# Altium schematic sheet 1_P1.schdoc
size 601 x 429 mm; Symbol: Sheet-Symbol_A3; Device: Sheet-Symbol_A3; Company: 嘉立创EDA; Version: V1.0; Page Size: A3; @Project Name: ESP-SparkBot; @Page Count: 1; @Update Date: 2024-12-25; @Create Date: 2024-10-15; @Schematic Name: SCH_ESP_SparkBot; @Page No: 1; @Page Name: P1; @Board Name: ESP_SparkBot_MainBoard; @Create Time: 11:45:12; @Update Time: 18:40:32; Width: 2338; Height: 1652; Region Start: 1; X Region Count: 6; Y Region Count: 4; Blade Width: 10; Title Block Position: 3
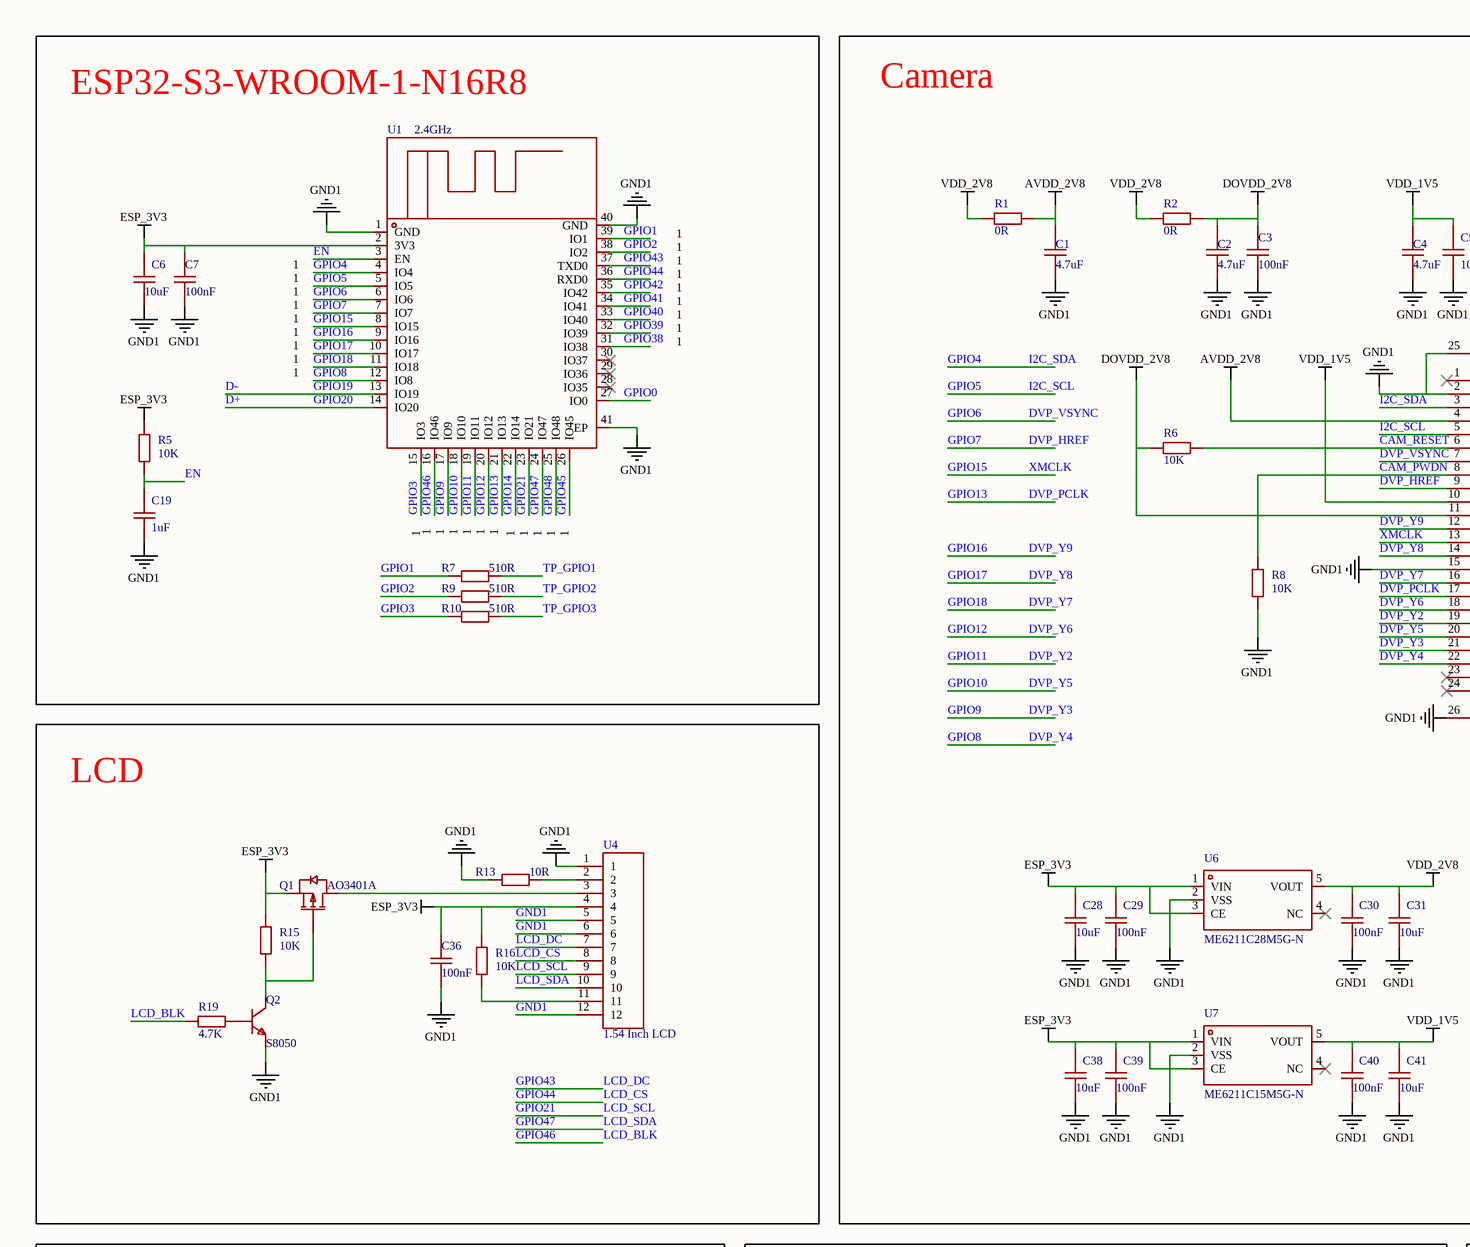
[diagram p0: 1_P1.schdoc, top left]
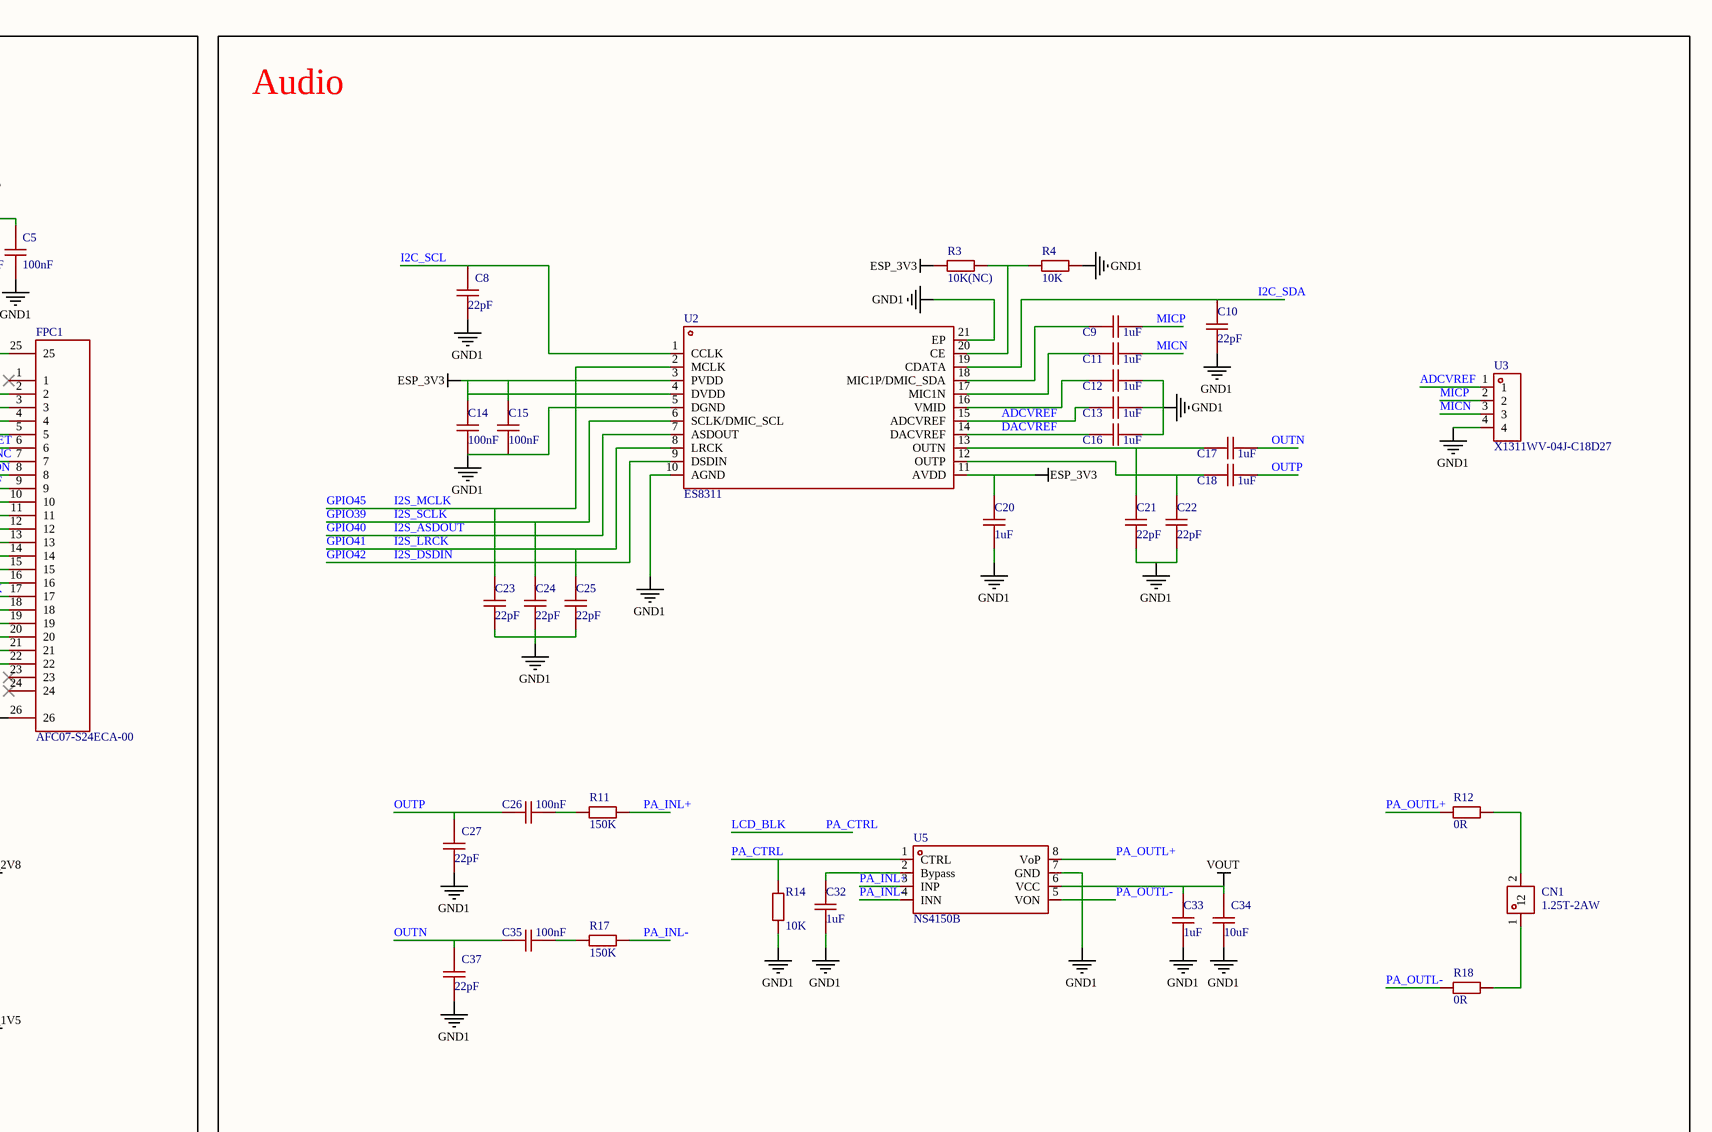
[diagram p1: 1_P1.schdoc, top right]
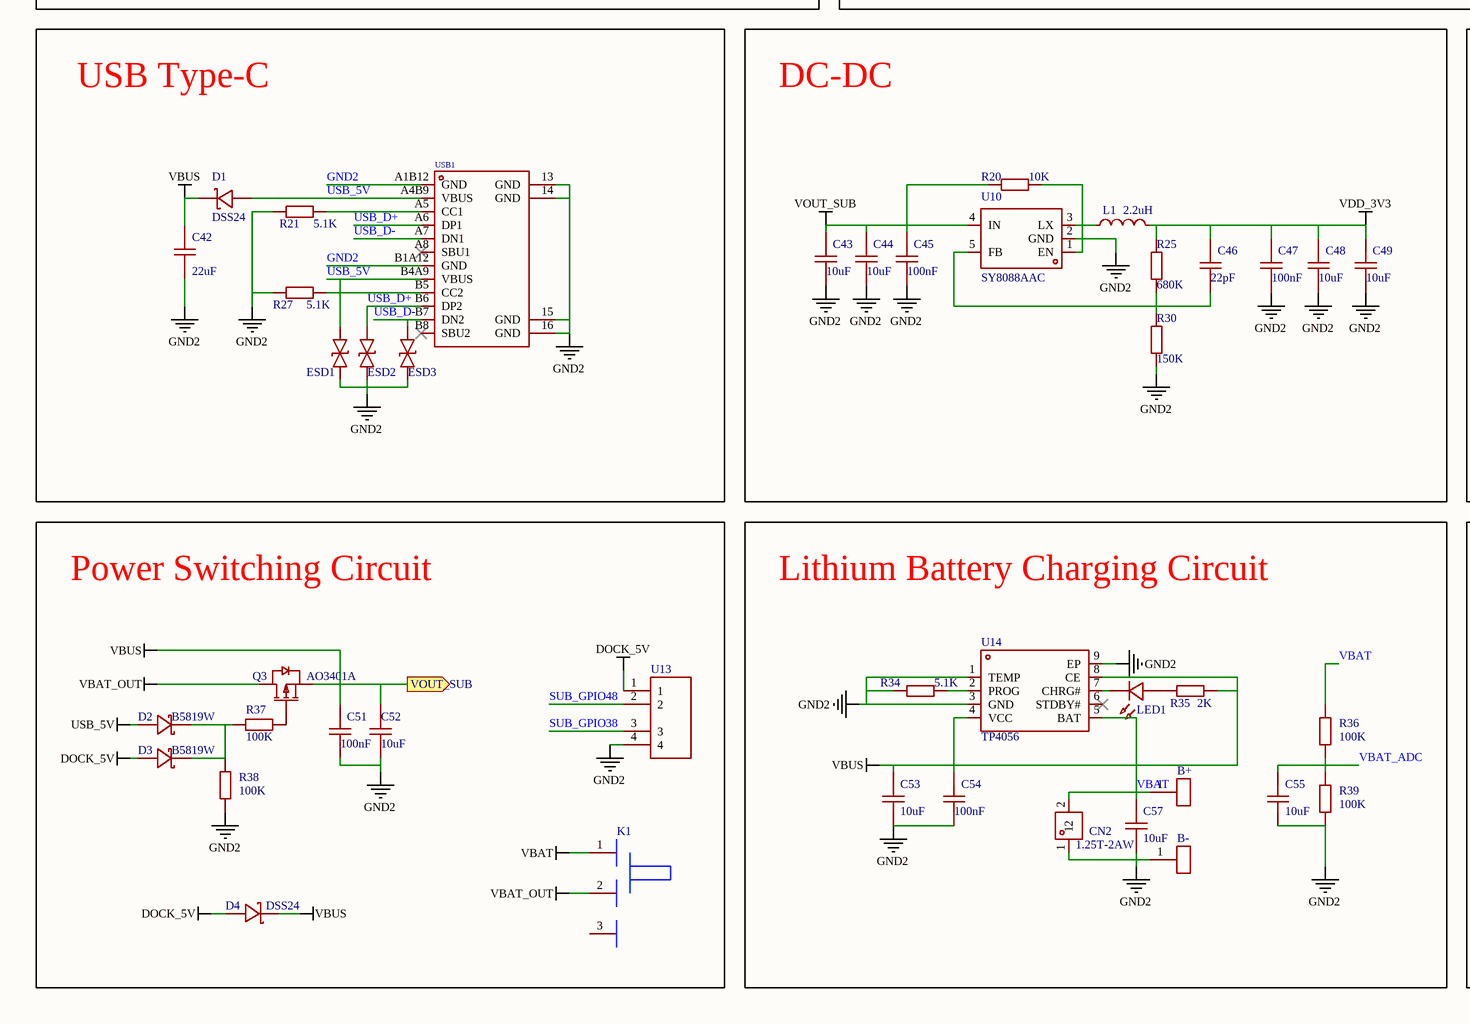
[diagram p2: 1_P1.schdoc, bottom left]
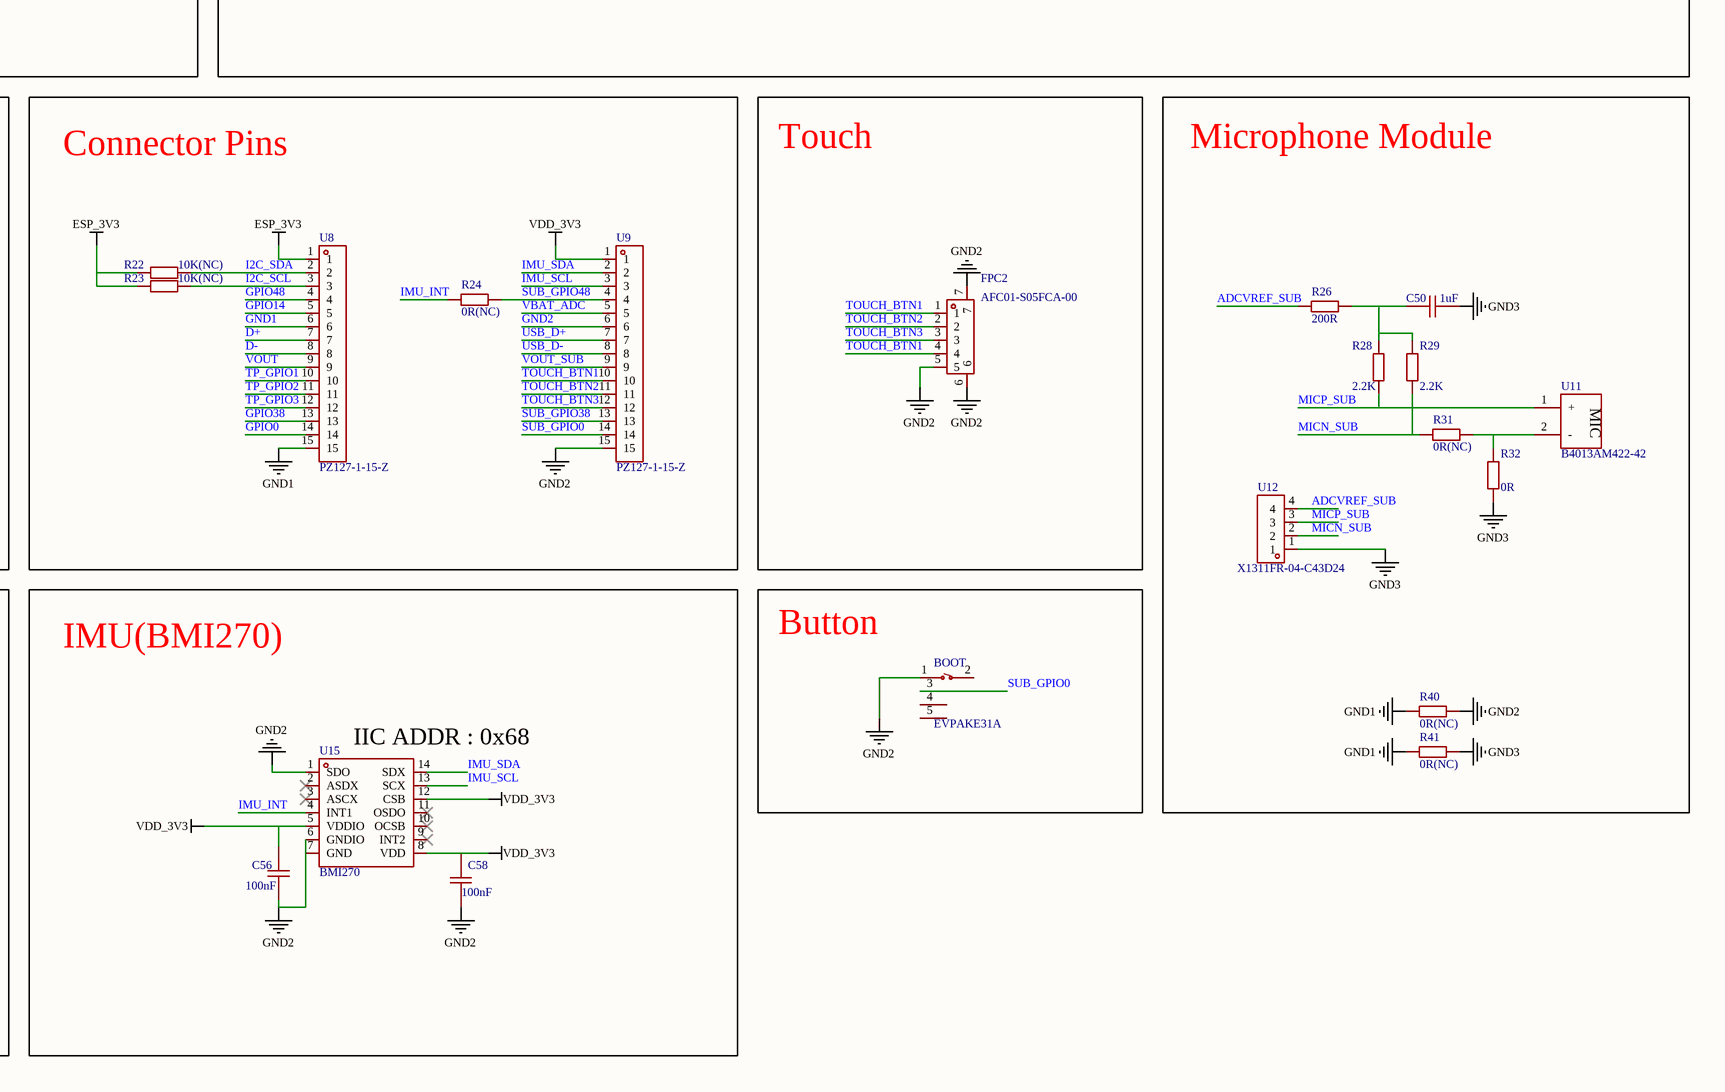
[diagram p3: 1_P1.schdoc, bottom right]

## Parts
B+  (no value)  [test_point]
B-  (no value)  [test_point]
BOOT  EVPAKE31A  [SW-TH_PANASONIC_EVPAKE31A]
C1  4.7uF  [C0402]
C2  4.7uF  [C0402]
C3  100nF  [C0402]
C4  4.7uF  [C0402]
C5  100nF  [C0402]
C6  10uF  [C0603]
C7  100nF  [C0402]
C8  22pF  [C0402]
C9  1uF  [C0402]
C10  22pF  [C0402]
C11  1uF  [C0402]
C12  1uF  [C0402]
C13  1uF  [C0402]
C14  100nF  [C0402]
C15  100nF  [C0402]
C16  1uF  [C0402]
C17  1uF  [C0402]
C18  1uF  [C0402]
C19  1uF  [C0402]
C20  1uF  [C0402]
C21  22pF  [C0402]
C22  22pF  [C0402]
C23  22pF  [C0402]
C24  22pF  [C0402]
C25  22pF  [C0402]
C26  100nF  [C0402]
C27  22pF  [C0402]
C28  10uF  [C0603]
C29  100nF  [C0402]
C30  100nF  [C0402]
C31  10uF  [C0603]
C32  1uF  [C0402]
C33  1uF  [C0402]
C34  10uF  [C0603]
C35  100nF  [C0402]
C36  100nF  [C0402]
C37  22pF  [C0402]
C38  10uF  [C0603]
C39  100nF  [C0402]
C40  100nF  [C0402]
C41  10uF  [C0603]
C42  22uF  [C0805]
C43  10uF  [C0603]
C44  10uF  [C0603]
C45  100nF  [C0402]
C46  22pF  [C0402]
C47  100nF  [C0402]
C48  10uF  [C0603]
C49  10uF  [C0603]
C50  1uF  [C0603]
C51  100nF  [C0402]
C52  10uF  [C0603]
C53  10uF  [C0603]
C54  100nF  [C0402]
C55  10uF  [C0603]
C56  100nF  [C0402]
C57  10uF  [C0603]
C58  100nF  [C0402]
CN1  1.25T-2AW  [CONN-TH_1.25T-2AW]
CN2  1.25T-2AW  [CONN-TH_1.25T-2AW]
D1  DSS24  [SOD-123_L2.8-W1.8-LS3.7-RD]
D2  B5819W  [SOD-123_L2.7-W1.6-LS3.7-FD]
D3  B5819W  [SOD-123_L2.7-W1.6-LS3.7-FD]
D4  DSS24  [SOD-123_L2.8-W1.8-LS3.7-RD]
ESD1  LESD5D5.0CT1G  [SOD-523_L1.2-W0.8-LS1.6-BI]  (value not drawn)
ESD2  LESD5D5.0CT1G  [SOD-523_L1.2-W0.8-LS1.6-BI]  (value not drawn)
ESD3  LESD5D5.0CT1G  [SOD-523_L1.2-W0.8-LS1.6-BI]  (value not drawn)
FPC1  AFC07-S24ECA-00  [FPC-SMD_AFC07-S24ECA-00]
FPC2  AFC01-S05FCA-00  [FPC-SMD_AFC01-S05FCA-00]
K1  (no value)  [SS-12D00G4]
L1  2.2uH  [IND-SMD_L3.0-W3.0_FNR30XXS]
LED1  (no value)  [LED_0603]
Q1  AO3401A  [SOT-23_L2.9-W1.3-P1.90-LS2.4-BR]
Q2  S8050  [SOT-23-3_L2.9-W1.6-P1.90-LS2.8-BR]
Q3  AO3401A  [SOT-23_L2.9-W1.3-P1.90-LS2.4-BR]
R1  0R  [R0402]
R2  0R  [R0402]
R3  10K(NC)  [R0402]
R4  10K  [R0402]
R5  10K  [R0402]
R6  10K  [R0402]
R7  510R  [R0402]
R8  10K  [R0402]
R9  510R  [R0402]
R10  510R  [R0402]
R11  150K  [R0402]
R12  0R  [R0402]
R13  10R  [R0402]
R14  10K  [R0402]
R15  10K  [R0402]
R16  10K  [R0402]
R17  150K  [R0402]
R18  0R  [R0402]
R19  4.7K  [R0402]
R20  10K  [R0402]
R21  5.1K  [R0402]
R22  10K(NC)  [R0402]
R23  10K(NC)  [R0402]
R24  0R(NC)  [R0402]
R25  680K  [R0402]
R26  200R  [R0402]
R27  5.1K  [R0402]
R28  2.2K  [R0402]
R29  2.2K  [R0402]
R30  150K  [R0402]
R31  0R(NC)  [R0402]
R32  0R  [R0402]
R34  5.1K  [R0402]
R35  2K  [R0402]
R36  100K  [R0402]
R37  100K  [R0402]
R38  100K  [R0402]
R39  100K  [R0402]
R40  0R(NC)  [R0402]
R41  0R(NC)  [R0402]
U1  2.4GHz  [WIFIM-SMD_ESP32-S3-WROOM-1-N8]
U2  ES8311  [WQFN-20_L3.0-W3.0-P0.40-BL-EP1.7]
U3  X1311WV-04J-C18D27  [HDR-TH_4P-P1.27-V-M]
U4  1.54 Inch LCD  [LCD_12P_0.7M]
U5  NS4150B  [MSOP-8_L3.0-W3.0-P0.65-LS5.0-BL]
U6  ME6211C28M5G-N  [SOT-23-5_L3.0-W1.7-P0.95-LS2.8-BR]
U7  ME6211C15M5G-N  [SOT-23-5_L3.0-W1.7-P0.95-LS2.8-BR]
U8  PZ127-1-15-Z  [HDR-TH_15P-P1.27-V-M]
U9  PZ127-1-15-Z  [HDR-TH_15P-P1.27-V-M]
U10  SY8088AAC  [SOT-23-5_L3.0-W1.7-P0.95-LS2.8-BR]
U11  B4013AM422-42  [MIC-SMD_3P-BD4.0-P1.35_B4013AM423-093]
U12  X1311FR-04-C43D24  [HDR-TH_4P-P1.27-H-F-W4.5-N]
U13  (no value)  [磁吸母座_4P]
U14  TP4056  [ESOP-8_L4.9-W3.9-P1.27-LS6.0-BL-EP]
U15  BMI270  [LGA-14_L3.0-W2.5-P0.50-BR]
USB1  TYPEC-304YSSW-ACP16  [USB-SMD_TYPEC-304YSSW-ACP16]  (value not drawn)

## Blocks framed on the sheet
ESP32-S3-WROOM-1-N16R8: C6 C7 C19 R5 R7 R9 R10 U1
Camera: C1-C5 C28-C31 C38-C41 FPC1 R1 R2 R6 R8 U6 U7
Audio: C8-C18 C20-C27 C32-C35 C37 CN1 R3 R4 R11 R12 R14 R17 R18 U2 U3 U5
LCD: C36 Q1 Q2 R13 R15 R16 R19 U4
USB Type-C: C42 D1 ESD1-ESD3 R21 R27 USB1
DC-DC: C43-C49 L1 R20 R25 R30 U10
Connector Pins: R22-R24 U8 U9
Touch: FPC2
Microphone Module: C50 R26 R28 R29 R31 R32 R40 R41 U11 U12
Power Switching Circuit: C51 C52 D2-D4 K1 Q3 R37 R38 U13
Lithium Battery Charging Circuit: B+ B- C53-C55 C57 CN2 LED1 R34-R36 R39 U14
IMU(BMI270): C56 C58 U15
Button: BOOT

## Ports
VOUT_SUB (out)

## Nets
AVDD_2V8: C1.2 FPC1.4 R1.2
DOCK_5V: D3.1(A) D4.2(A) U13.1
DOVDD_2V8: C2.2 C3.2 FPC1.11 R2.2 R6.1
ESP_3V3: C6.2 C7.2 C14.1 C15.1 C20.2 C28.2 C29.2 C36.2 C38.2 C39.2 Q1.2(S) R3.2 R5.2 R15.2 R16.2 R22.1 R23.1 U1.2(3V3) U2.3(PVDD) U2.4(DVDD) U2.11(AVDD) U4.4 U6.1(VIN) U6.3(CE) U7.1(VIN) U7.3(CE) U8.1
GND1: C1.1 C2.1 C3.1 C4.1 C5.1 C6.1 C7.1 C8.1 C10.1 C12.1 C13.1 C14.2 C15.2 C16.1 C19.1 C20.1 C21.1 C22.1 C23.1 C24.1 C25.1 C27.1 C28.1 C29.1 C30.1 C31.1 C32.1 C33.1 C34.1 C36.1 C37.1 C38.1 C39.1 C40.1 C41.1 FPC1.2 FPC1.15 FPC1.25 FPC1.26 Q2.2 R4.1 R8.1 R13.1 R14.1 R40.1 R41.1 U1.1(GND) U1.40(GND) U1.41(EP) U2.5(DGND) U2.10(AGND) U2.21(EP) U3.4 U4.1 U4.5 U4.6 U4.12 U5.7(GND) U6.2(VSS) U7.2(VSS) U8.6 U8.15
GND2: B-.1 BOOT.1(A) C42.1 C43.1 C44.1 C45.1 C47.1 C48.1 C49.1 C51.1 C52.1 C53.1 C54.1 C55.1 C56.1 C57.1 C58.1 CN2.1 ESD1.1 ESD2.1 ESD3.1 FPC2.5 FPC2.6 FPC2.7 R21.2 R27.2 R30.1 R34.1 R38.2 R39.2 R40.2 U9.6 U9.15 U10.2(GND) U13.4 U14.1(TEMP) U14.3(GND) U14.9(EP) U15.1(SDO) U15.6(GNDIO) U15.7(GND) USB1.13(GND) USB1.14(GND) USB1.15(GND) USB1.16(GND) USB1.A1B12(GND) USB1.B1A12(GND)
GND3: C50.1 R32.1 R41.2 U12.1
USB_5V: D1.2(A) D2.1(A) ESD1.2 USB1.A4B9(VBUS) USB1.B4A9(VBUS)
VBAT: B+.1 C57.2 CN2.2 K1.1 R36.1 U14.5(BAT)
VBAT_OUT: K1.2 Q3.3(D)
VBUS: C42.2 C51.2 C52.2 C53.2 C54.2 D1.1(C) D4.1(C) Q3.2(S) R35.2 U14.4(VCC) U14.8(CE) ; port VOUT_SUB
VDD_1V5: C4.2 C5.2 C40.2 C41.2 FPC1.10 U7.5(VOUT)
VDD_2V8: C30.2 C31.2 R1.1 R2.1 U6.5(VOUT)
VDD_3V3: C46.2 C47.2 C48.2 C49.2 C56.2 C58.2 L1.2 R25.2 U9.1 U15.5(VDDIO) U15.8(VDD) U15.12(CSB)
VOUT: C33.2 C34.2 U5.6(VCC) U8.9
VOUT_SUB: C43.2 C44.2 C45.2 R20.2 U9.9 U10.4(IN)
ADCVREF: C13.2 U2.15(ADCVREF) U3.1
ADCVREF_SUB: R26.1 U12.4
CAM_PWDN: FPC1.8 R8.2
CAM_RESET: FPC1.6 R6.2
D+: U1.14(IO20) U8.7  [also labelled GPIO20]
D-: U1.13(IO19) U8.8  [also labelled GPIO19]
DACVREF: C16.2 U2.14(DACVREF)
DVP_HREF: FPC1.9 U1.7(IO7)  [also labelled GPIO7]
DVP_PCLK: FPC1.17 U1.21(IO13)  [also labelled GPIO13]
DVP_VSYNC: FPC1.7 U1.6(IO6)  [also labelled GPIO6]
DVP_Y2: FPC1.19 U1.19(IO11)  [also labelled GPIO11]
DVP_Y3: FPC1.21 U1.17(IO9)  [also labelled GPIO9]
DVP_Y4: FPC1.22 U1.12(IO8)  [also labelled GPIO8]
DVP_Y5: FPC1.20 U1.18(IO10)  [also labelled GPIO10]
DVP_Y6: FPC1.18 U1.20(IO12)  [also labelled GPIO12]
DVP_Y7: FPC1.16 U1.11(IO18)  [also labelled GPIO18]
DVP_Y8: FPC1.14 U1.10(IO17)  [also labelled GPIO17]
DVP_Y9: FPC1.12 U1.9(IO16)  [also labelled GPIO16]
EN: C19.2 R5.1 U1.3(EN)
GPIO0: U1.27(IO0) U8.14
GPIO1: R7.1 U1.39(IO1)
GPIO2: R9.1 U1.38(IO2)
GPIO3: R10.1 U1.15(IO3)
GPIO4: C10.2 FPC1.3 R22.2 U1.4(IO4) U2.19(CDATA) U8.2  [also labelled I2C_SDA]
GPIO5: C8.2 FPC1.5 R23.2 U1.5(IO5) U2.1(CCLK) U8.3  [also labelled I2C_SCL]
GPIO14: U1.22(IO14) U8.5
GPIO15: FPC1.13 U1.8(IO15)  [also labelled XMCLK]
GPIO21: U1.23(IO21) U4.9  [also labelled LCD_SCL]
GPIO38: U1.31(IO38) U8.13
GPIO39: C24.2 U1.32(IO39) U2.6(SCLK/DMIC_SCL)  [also labelled I2S_SCLK]
GPIO40: U1.33(IO40) U2.7(ASDOUT)  [also labelled I2S_ASDOUT]
GPIO41: C25.2 U1.34(IO41) U2.8(LRCK)  [also labelled I2S_LRCK]
GPIO42: U1.35(IO42) U2.9(DSDIN)  [also labelled I2S_DSDIN]
GPIO43: U1.37(TXD0) U4.7  [also labelled LCD_DC]
GPIO44: U1.36(RXD0) U4.8  [also labelled LCD_CS]
GPIO45: C23.2 U1.26(IO45) U2.2(MCLK)  [also labelled I2S_MCLK]
GPIO46: R14.2 R19.1 U1.16(IO46) U5.1(CTRL)  [also labelled LCD_BLK, PA_CTRL]
GPIO47: U1.24(IO47) U4.10  [also labelled LCD_SDA]
GPIO48: U1.25(IO48) U8.4
IMU_INT: R24.1 U15.4(INT1)
IMU_SCL: U9.3 U15.13(SCX)
IMU_SDA: U9.2 U15.14(SDX)
MICN: C11.1 U3.3
MICN_SUB: R29.1 R31.1 U12.2
MICP: C9.1 U3.2
MICP_SUB: R28.1 U11.1(+) U12.3
OUTN: C17.1 C35.2 C37.2
OUTP: C18.1 C26.2 C27.2
PA_INL+: R11.1 U5.3(INP)
PA_INL-: R17.1 U5.4(INN)
PA_OUTL+: R12.1 U5.8(VoP)
PA_OUTL-: R18.1 U5.5(VON)
SUB_GPIO0: BOOT.3 U9.14
SUB_GPIO38: U9.13 U13.3
SUB_GPIO48: R24.2 U9.4 U13.2
TOUCH_BTN1: FPC2.1 FPC2.4 U9.10
TOUCH_BTN2: FPC2.2 U9.11
TOUCH_BTN3: FPC2.3 U9.12
TP_GPIO1: R7.2 U8.10
TP_GPIO2: R9.2 U8.11
TP_GPIO3: R10.2 U8.12
USB_D+: ESD2.2 U9.7 USB1.A6(DP1) USB1.B6(DP2)
USB_D-: ESD3.2 U9.8 USB1.A7(DN1) USB1.B7(DN2)
VBAT_ADC: C55.2 R36.2 R39.1 U9.5
NetC9_2: C9.2 U2.18(MIC1P/DMIC_SDA)
NetC11_2: C11.2 U2.17(MIC1N)
NetC12_2: C12.2 U2.16(VMID)
NetC17_2: C17.2 C21.2 U2.13(OUTN)
NetC18_2: C18.2 C22.2 U2.12(OUTP)
NetC26_1: C26.1 R11.2
NetC32_2: C32.2 U5.2(Bypass)
NetC35_1: C35.1 R17.2
NetC46_1: C46.1 R25.1 R30.2 U10.5(FB)
NetC50_2: C50.2 R26.2 R28.2 R29.2
NetCN1_1: CN1.1 R18.2
NetCN1_2: CN1.2 R12.2
NetD2_2: D2.2(K) D3.2(K) R37.1 R38.1
NetL1_1: L1.1 U10.3(LX)
NetLED1_1: LED1.1(C) U14.7(CHRG#)
NetLED1_2: LED1.2(A) R35.1
NetQ1_1: Q1.1(G) Q2.3 R15.1
NetQ1_3: Q1.3(D) U4.3
NetQ2_1: Q2.1 R19.2
NetQ3_1: Q3.1(G) R37.2
NetR3_1: R3.1 R4.2 U2.20(CE)
NetR13_2: R13.2 U4.2
NetR16_1: R16.1 U4.11
NetR20_1: R20.1 U10.1(EN)
NetR21_1: R21.1 USB1.A5(CC1)
NetR27_1: R27.1 USB1.B5(CC2)
NetR31_2: R31.2 R32.2 U11.2(-)
NetR34_2: R34.2 U14.2(PROG)

Not connected (* = marked no-connect by the designer): BOOT 2(A&apos;) 4 5; FPC1 1* 23* 24*; K1 3; U1 28(IO35)* 29(IO36)* 30(IO37)*; U6 4(NC)*; U7 4(NC)*; U14 6(STDBY#)*; U15 2(ASDX)* 3(ASCX)* 9(INT2)* 10(OCSB)* 11(OSDO)*; USB1 A8(SBU1)* B8(SBU2)*

## Notes on the sheet
- 1
- (near U15) IIC ADDR : 0x68
- 2
- 3
- 4
- 5
- 6
- A
- B
- C
- D
- 原理图
- SCH_ESP_SparkBot
- 创建日期
- 更新日期
- 2024-12-25
- 2024-10-15
- 绘制
- 图页
- P1
- 物料编码
- 审阅
- 版本
- 尺寸
- ESP-SparkBot
- 页
- 共
- V1.0
- A3
- 嘉立创EDA
- (in symbol B4013AM422-42) MIC

## Library data of the parts
B+ B- = test_point: Add into BOM: yes; Symbol: test_point; Device: test_point; Convert to PCB: yes
BOOT = EVPAKE31A: Manufacturer: PANASONIC(松下); Add into BOM: yes; Contact Current: 20mA; Voltage Rating (DC): 15V; Insulation Resistance: 100MΩ; Circuit: 单刀单掷; Actuator Style: 方形按钮; Actuator/Cap Color: 白色; Operating Force: 1.6N; Mechanical Life: 50万次; IP Rating: IP67; Pin Style: J型引脚; Switch Length: 3.9mm; Switch Width: 2.9mm; Switch Height: 1.6mm; Strike Gundam: 是; Symbol: EVPAKE31A; Device: EVPAKE31A; LCSC Part Name: 3.9*2.9*1.6mm 立贴 轻触开关; Supplier Part: C569760; Manufacturer Part: EVPAKE31A; Supplier Footprint: SMD,2.9x3.9mm; Datasheet: https://atta.szlcsc.com/upload/public/pdf/source/20230111/5A533F4FA0F4DB44B973F42B55696777.pdf; Supplier: LCSC; Convert to PCB: yes; Voltage Rating (AC): -; Power Rating: -; Mounting Style: 立贴; With Lamp: -; Operating Temperature: -40℃~+85℃
C1-C5 C7-C27 C29 C30 C32 C33 C35-C37 C39 C40 C45-C47 C51 C54 C56 C58 = CAP_0402: Symbol: CapAcitance; Convert to PCB: yes; Device: CAP_0402; Add into BOM: yes; Supplier Footprint: 0402
  C1 C2 C4: Value: 4.7uF
  C3 C5 C7 C14 C15 C26 C29 C30 C35 C36 C39 C40 C45 C47 C51 C54 C56 C58: Value: 100nF
  C8 C10 C21-C25 C27 C37 C46: Value: 22pF
  C9 C11-C13 C16-C20 C32 C33: Value: 1uF
C6 C28 C31 C34 C38 C41 C43 C44 C48-C50 C52 C53 C55 C57 = CAP_0603: Symbol: CapAcitance; Convert to PCB: yes; Device: CAP_0603; Add into BOM: yes; Supplier Footprint: 0603
  C6 C28 C31 C34 C38 C41 C43 C44 C48 C49 C52 C53 C55 C57: Value: 10uF
  C50: Value: 1uF
C42 = CAP_0805: Symbol: CapAcitance; Convert to PCB: yes; Device: CAP_0805; Add into BOM: yes; Supplier Footprint: 0805; Value: 22uF
CN1 CN2 = 1.25T-2AW: Manufacturer: CAX(创都); Symbol: 1.25T-2AW_C722634; Add into BOM: yes; Pins Structure: 1x2P; Pitch: 1.25mm; Number of PINs Per Row: 2; Current Rating (Max): 1A; Device: 1.25T-2AW; LCSC Part Name: 1x2P 间距:1.25mm 弯插; Supplier Part: C722634; Manufacturer Part: 1.25T-2AW; Supplier Footprint: 弯插,P=1.25mm; Datasheet: https://atta.szlcsc.com/upload/public/pdf/source/20200831/C722634_24F26787281092EEA77CD6D878338187.pdf; Supplier: LCSC; Convert to PCB: yes; Mounting Style: 弯插; Reference Series: -; Number of Pins: 2P; Number of Rows: 1; Row Spacing: -; Operating Temperature Range: -25℃~+85℃
D1 D4 = DSS24: Manufacturer: BORN(伯恩半导体); Symbol: DSS24_C511865; Add into BOM: yes; Forward Voltage (Vf@If): 550mV@2A; Reverse Voltage (Vr): 40V; Average Rectified Current (Io): 2A; Device: DSS24; Supplier: LCSC; Supplier Part: C511865; Manufacturer Part: DSS24; LCSC Part Name: 电压:40V 电流:2A; Supplier Footprint: SOD-123; Datasheet: https://atta.szlcsc.com/upload/public/pdf/source/20200413/C511865_530A4A8DFA4BF76EA49400B00C28BC33.pdf; Convert to PCB: yes
D2 D3 = B5819W_C7420330: Manufacturer: 宏迦橙; Add into BOM: yes; Diode Configuration: 独立式; Forward Voltage (Vf@If): 550mV@1.0A; Reverse Voltage (Vr): 40V; Average Rectified Current (Io): 1A; Reverse Leakage Current (Ir): 1mA@30V; Peak forward surge current: 9A; Symbol: B5819W_C7420330; Device: B5819W_C7420330; Supplier: LCSC; Supplier Part: C7420330; Manufacturer Part: B5819W; LCSC Part Name: 电压:40V 电流:1A; Supplier Footprint: SOD-123; Datasheet: https://atta.szlcsc.com/upload/public/pdf/source/20230828/EE0D571642CD3E42C48F1182066654A1.pdf; Convert to PCB: yes
ESD1-ESD3 = LESD5D5.0CT1G: Manufacturer: LRC(乐山无线电); Add into BOM: yes; Polarity: 双向; Reverse Stand-Off Voltage (Vrwm): 5V; Breakdown Voltage (VBR): 5.6V; Peak Pulse Current(Ipp)@8/20us: 9.4A; Clamping Voltage@Ipp: 18.6V; Symbol: LESD5D5.0CT1G; Device: LESD5D5.0CT1G; LCSC Part Name: 双向ESD; Supplier Part: C383211; Manufacturer Part: LESD5D5.0CT1G; Supplier Footprint: SOD-523; Datasheet: https://atta.szlcsc.com/upload/public/pdf/source/20190807/C383211_633DF4B4E2C161403226E5235FE33A1C.pdf; Supplier: LCSC; Convert to PCB: yes
FPC1 = AFC07-S24ECA-00: Manufacturer: JS(钜硕电子); Add into BOM: yes; Locking Feature: 抽屉式; Number of Contacts: 24P; Pitch: 0.5mm; FFC, FCB Thickness: 0.3mm; Symbol: AFC07-S24ECA-00; Device: AFC07-S24ECA-00; LCSC Part Name: 间距:0.5mm P数:24P 抽屉式 上接; Supplier Part: C262643; Manufacturer Part: AFC07-S24ECA-00; Supplier Footprint: SMD,P=0.5mm,卧贴; JLCPCB Part Class: 扩展库; Datasheet: https://atta.szlcsc.com/upload/public/pdf/source/20190726/C11082_A2E7B12387019CE4314BB5199EE0FDF4.pdf; Supplier: LCSC; Convert to PCB: yes; Contact Type: 上接; Mounting Type: 卧贴; Height Above Board: 2mm
FPC2 = AFC01-S05FCA-00: Manufacturer: JS(钜硕电子); Add into BOM: yes; Locking Feature: 翻盖式; Number of Contacts: 5P; Pitch: 0.5mm; FFC, FCB Thickness: 0.3mm; Symbol: AFC01-S05FCA-00; Device: AFC01-S05FCA-00; Supplier: LCSC; Supplier Part: C262654; Manufacturer Part: AFC01-S05FCA-00; JLCPCB Part Class: 扩展库; LCSC Part Name: 间距:0.5mm P数:5P 翻盖式 下接; Supplier Footprint: SMD,P=0.5mm,卧贴; Datasheet: https://atta.szlcsc.com/upload/public/pdf/source/20190816/C413942_2A72D1AC756EAE17EEDF756A339D4500.pdf; Convert to PCB: yes; Contact Type: 下接; Mounting Type: 卧贴; Height Above Board: 2mm
K1 = SS-12D00G4-4MM: Add into BOM: yes; Symbol: SS-12D00G4-4MM; Device: SS-12D00G4-4MM; Convert to PCB: yes
L1 = FNR3015S2R2MT: Manufacturer: cjiang(长江微电); Add into BOM: yes; Tolerance: ±20%; Rated Current: 2A; DC Resistance (DCR): 78mΩ; Symbol: FNR3015S2R2MT; Device: FNR3015S2R2MT; LCSC Part Name: 2.2uH ±20% 2A; Supplier Part: C167747; Manufacturer Part: FNR3015S2R2MT; Supplier Footprint: SMD,3x3mm; JLCPCB Part Class: 扩展库; Datasheet: https://atta.szlcsc.com/upload/public/pdf/source/20190327/C167925_9EFF0AABC4CA629C2CC95961DBF7D39D.pdf; Supplier: LCSC; Convert to PCB: yes; Value: 2.2uH; Saturation Current (Isat): 2A
LED1 = LED_0603-R: Symbol: LED_R; Convert to PCB: yes; Device: LED_0603-R; Add into BOM: yes; Supplier Footprint: 0603
Q1 Q3 = AO3401A_C15127: Manufacturer: AOS; Add into BOM: yes; Type: P沟道; Drain Source Voltage (Vdss): 30V; Continuous Drain Current (Id): 4A; Power Dissipation (Pd): 1.4W; Drain Source On Resistance (RDS(on)@Vgs,Id): 44mΩ@10V,4.3A; Gate Threshold Voltage (Vgs(th)@Id): 1.3V@250uA; Total Gate Charge (Qg@Vgs): 12.2nC@4.5V; Input Capacitance (Ciss@Vds): 1.2nF@15V; Symbol: AO3401A; Device: AO3401A_C15127; LCSC Part Name: P沟道 耐压:30V 电流:4A; Supplier Part: C15127; Manufacturer Part: AO3401A; Supplier Footprint: SOT-23; Datasheet: https://atta.szlcsc.com/upload/public/pdf/source/20160507/1462613609053.pdf; Supplier: LCSC; Convert to PCB: yes; Operating Temperature: -55℃~+150℃@(Tj)
Q2 = S8050_C181158: Manufacturer: Hottech(合科泰); Add into BOM: yes; Transistor Type: NPN; Collector Current (Ic): 500mA; Collector-Emitter Breakdown Voltage (Vceo): 25V; Power Dissipation (Pd): 300mW; Transition Frequency (fT): 150MHz; Collector Cut-Off Current (Icbo): 100nA; Collector-Emitter Saturation Voltage (VCE(sat)@Ic,Ib): 600mV@500mA,50mA; Symbol: S8050_C181158; Device: S8050_C181158; Supplier: LCSC; Manufacturer Part: S8050; Supplier Part: C181158; JLCPCB Part Class: 扩展库; LCSC Part Name: NPN 电流:500mA 耐压:25V; Supplier Footprint: SOT-23; Datasheet: https://atta.szlcsc.com/upload/public/pdf/source/20220506/D987F39D56F2975D34EC7947E75C4ABC.pdf; Convert to PCB: yes; Operating Temperature: -
R1-R32 R34-R41 = Res_0402: Symbol: 电阻; Convert to PCB: yes; Device: Res_0402; Add into BOM: yes; Supplier Footprint: 0402
  R1 R2 R12 R18 R32: Value: 0R
  R3 R22 R23: Value: 10K(NC)
  R4-R6 R8 R14-R16 R20: Value: 10K
  R7 R9 R10: Value: 510R
  R11 R17 R30: Value: 150K
  R13: Value: 10R
  R19: Value: 4.7K
  R21 R27 R34: Value: 5.1K
  R24 R31 R40 R41: Value: 0R(NC)
  R25: Value: 680K
  R26: Value: 200R
  R28 R29: Value: 2.2K
  R35: Value: 2K
  R36-R39: Value: 100K
U1 = ESP32-S3-WROOM-1-N8: Manufacturer: ESPRESSIF(乐鑫); Add into BOM: yes; Core Processor: ESP32-S3芯片; Support Interface: I2C；GPIO；SPI；PWM；ADC；UART；USB；I2S; Symbol: ESP32-S3-WROOM-1-N8; Device: ESP32-S3-WROOM-1-N8; Supplier: LCSC; Supplier Part: C2913198; Manufacturer Part: ESP32-S3-WROOM-1-N8; JLCPCB Part Class: 扩展库; LCSC Part Name: 通用型Wi-Fi+低功耗蓝牙MCU模组; Supplier Footprint: SMD,18x25.5mm; Datasheet: https://atta.szlcsc.com/upload/public/pdf/source/20221026/9A44C6421221D672346AAE72DF9F8146.pdf; Convert to PCB: yes; Value: 2.4GHz
U2 = ES8311: Manufacturer: Everest-semi(顺芯); Add into BOM: yes; Symbol: ES8311; Device: ES8311; LCSC Part Name: ES8311; Supplier Part: C962342; Manufacturer Part: ES8311; Supplier Footprint: WQFN-20-EP(3x3); JLCPCB Part Class: 扩展库; Datasheet: https://atta.szlcsc.com/upload/public/pdf/source/20210630/C962342_E665EAE7274179BC7C5A390EC8AC685C.pdf; Supplier: LCSC; Convert to PCB: yes
U3 = X1311WV-04J-C18D27: Manufacturer: XKB Connection(中国星坤); Add into BOM: yes; Pin Structure: 1x4P; Pitch: 1.27mm; Circluar Pins/Square Pins: 方针; Current Rating (Max): 1A; Voltage Rating (Max): 250V; Soldering Temperature(Max): 260℃; Symbol: X1311WV-04J-C18D27; Device: X1311WV-04J-C18D27; LCSC Part Name: 1x4P 间距:1.27mm 方针; Supplier Part: C2881649; Manufacturer Part: X1311WV-04J-C18D27; Supplier Footprint: 插件,P=1.27mm; JLCPCB Part Class: 扩展库; Datasheet: https://atta.szlcsc.com/upload/public/pdf/source/20211011/BDECBA1A8033BEEEAFBA4B601EFBF35E.pdf; Supplier: LCSC; Convert to PCB: yes; Row Spacing: 1.27mm; Mounting Type: -; Number of Rows: 单排; Number of Pins: 4P; Length of Mating Pin: -; Insulation Height: 1mm; Length of End Connection Pin: -; Contact Material: 黄铜; Contact Plating: 金; Operating Temperature Range: -40℃~+105℃; Color: 黑色
U4 = LCD_12P_0.7: Add into BOM: yes; Symbol: LCD_12P_0.7; Device: LCD_12P_0.7; Convert to PCB: yes
U5 = NS4150B_C189961: Manufacturer: Nsiway(纳芯威); Symbol: NS4150; Add into BOM: yes; Type of Power Amplifier: D类功放; Output Power: 3Wx1@4Ω; Supply Voltage: 3V~5.25V; Device: NS4150B_C189961; LCSC Part Name: NS4150B; Supplier Part: C189961; Manufacturer Part: NS4150B; Supplier Footprint: MSOP-8; JLCPCB Part Class: 扩展库; Datasheet: https://atta.szlcsc.com/upload/public/pdf/source/20220916/DAE631F3909B9CBB38BDE76E3E6D5896.pdf; Supplier: LCSC; Convert to PCB: yes
U6 = ME6211C28M5G-N: Manufacturer: MICRONE(南京微盟); Add into BOM: yes; Output Type: 固定; Maximum Input Voltage: 6V; Output Voltage: 2.8V; MAX Output Current: 450mA; Power Supply Rejection Ratio (PSRR): 70dB@(1kHz); Dropout Voltage: 220mV@(200mA); Output Polarity: 正极; Number of Outputs: 1; Symbol: ME6211C28M5G; Device: ME6211C28M5G-N; Supplier: LCSC; Manufacturer Part: ME6211C28M5G-N; Supplier Part: C53099; JLCPCB Part Class: 扩展库; LCSC Part Name: 输入6V 输出2.8V 450mA; Supplier Footprint: SOT-23-5; Datasheet: https://atta.szlcsc.com/upload/public/pdf/source/20171014/C53099_15079757529561038531.pdf; Convert to PCB: yes; standby current: -
U7 = ME6211C15M5G-N: Manufacturer: MICRONE(南京微盟); Add into BOM: yes; Output Type: 固定; Maximum Input Voltage: 6V; Output Voltage: 1.5V; MAX Output Current: 300mA; Power Supply Rejection Ratio (PSRR): 70dB@(1kHz); Output Polarity: 正极; Number of Outputs: 1; Symbol: ME6211C15M5G; Device: ME6211C15M5G-N; LCSC Part Name: 输入6V 输出1.5V 300mA; Supplier Part: C53100; Manufacturer Part: ME6211C15M5G-N; Supplier Footprint: SOT-23-5; JLCPCB Part Class: 扩展库; Datasheet: https://atta.szlcsc.com/upload/public/pdf/source/20151012/1457707445394.pdf; Supplier: LCSC; Convert to PCB: yes; Dropout Voltage: -; standby current: -
U8 U9 = PZ127-1-15-Z: Manufacturer: HCTL(华灿天禄); Add into BOM: yes; Pin Structure: 1x15P; Pitch: 1.27mm; Circluar Pins/Square Pins: 方针; Current Rating (Max): 1A; Soldering Temperature(Max): 260℃@10S; Symbol: pz127-1-15-z; Device: PZ127-1-15-Z; LCSC Part Name: 1x15P 间距:1.27mm 方针 直插; Supplier Part: C5372838; Manufacturer Part: PZ127-1-15-Z; Supplier Footprint: 插件,P=1.27mm; JLCPCB Part Class: 扩展库; Datasheet: https://atta.szlcsc.com/upload/public/pdf/source/20240407/11460212CBFB9238DF6EEC00AAE28C4B.pdf; Supplier: LCSC; Convert to PCB: yes; Row Spacing: -; Mounting Type: 直插; Number of Rows: 单排; Number of Pins: 15P; Voltage Rating (Max): -; Length of Mating Pin: 3.2mm; Insulation Height: 1.6mm; Length of End Connection Pin: 2.4mm; Contact Material: 黄铜; Operating Temperature Range: -40℃~+105℃; Color: 黑色
U10 = SY8088AAC: Manufacturer: silergy(矽力杰); Add into BOM: yes; Function: 降压型; Switch tube (built-in/external): 内置; Symbol: SY8088AAC; Device: SY8088AAC; LCSC Part Name: SY8088AAC; Supplier Part: C79313; Manufacturer Part: SY8088AAC; Supplier Footprint: SOT-23-5; JLCPCB Part Class: 扩展库; Datasheet: https://atta.szlcsc.com/upload/public/pdf/source/20170329/1490752163260.pdf; Supplier: LCSC; Convert to PCB: yes; Input Voltage: -; Output Current (Max): -; Switching Frequency: -; Synchronous Rectification: -; Number of Outputs: -; Topology: -
U11 = B4013AM422-42: Manufacturer: Goertek(歌尔); Add into BOM: yes; Symbol: B4013AM422-42; Device: B4013AM422-42; LCSC Part Name: 驻极体电容φ4.0*1.3mm 1.0V-10V 灵敏度-42dB; Supplier Part: C233793; Manufacturer Part: B4013AM422-42; Supplier Footprint: -; JLCPCB Part Class: 扩展库; Datasheet: https://atta.szlcsc.com/upload/public/pdf/source/20180814/C233793_43E8861140E7BA7E04B570EE6088229F.pdf; Supplier: LCSC; Convert to PCB: yes
U12 = X1311FR-04-C43D24: Manufacturer: XKB Connection(中国星坤); Add into BOM: yes; Holes Structure: 1x4P; Pitch: 1.27mm; Circular Hole / Square Hole: 方孔; Number of Holes: 4P; Current Rating (Max): 1A; Voltage Rating (Max): 250V; Holes Direction: 侧面; Soldering Temperature(Max): 260℃; Symbol: X1311FR-04-C43D24; Device: X1311FR-04-C43D24; LCSC Part Name: 间距:1.27mm 1x4P 弯插; Supplier Part: C2881475; Manufacturer Part: X1311FR-04-C43D24; Supplier Footprint: 弯插,P=1.27mm; JLCPCB Part Class: 扩展库; Datasheet: https://atta.szlcsc.com/upload/public/pdf/source/20211011/A24861EA633A2CD5B8EF341939930472.pdf; Supplier: LCSC; Convert to PCB: yes; Row Spacing: -; Mounting Type: 弯插; Number of Rows: 单排; Insulation Height: 4.3mm; Contact Material: 黄铜; Contact Plating: 金; Operating Temperature Range: -40℃~+105℃
U13 = 磁吸母座_4P: Add into BOM: yes; Symbol: 磁吸母座_4P; Device: 磁吸母座_4P; Convert to PCB: yes
U14 = TP4056_C725790: Manufacturer: UMW(友台半导体); Add into BOM: yes; Symbol: TP4056_C725790; Device: TP4056_C725790; Supplier: LCSC; Supplier Part: C725790; Manufacturer Part: TP4056; LCSC Part Name: TP4056; Supplier Footprint: ESOP-8; Datasheet: https://atta.szlcsc.com/upload/public/pdf/source/20231109/CF74897CE79A500F7FE27A45ADCCC631.pdf; Convert to PCB: yes
U15 = BMI270: Manufacturer: Bosch(博世); Add into BOM: yes; Sensor Type: 加速度计陀螺仪; Symbol: BMI270; Device: BMI270; LCSC Part Name: BMI270; Supplier Part: C2836813; Manufacturer Part: BMI270; Supplier Footprint: LGA-14(2.5x3); JLCPCB Part Class: 扩展库; Datasheet: https://atta.szlcsc.com/upload/public/pdf/source/20210625/C2836813_35E1F3F92097F45A3828DF13DDBA01A5.pdf; Supplier: LCSC; Convert to PCB: yes; Operating Temperature: -40℃~+85℃
USB1 = TYPEC-304YSSW-ACP16: Manufacturer: XUNPU(讯普); Add into BOM: yes; Connector Type: Type-C; Gender: 母座; Number of Contacts: 16P; Number of Ports: 1; Current Rating - Power (Max): 5A; Welding Temperature (Max): 260℃; Symbol: TYPEC-304YSSW-ACP16; Device: TYPEC-304YSSW-ACP16; Supplier: LCSC; Supplier Part: C2840392; Manufacturer Part: TYPEC-304YSSW-ACP16; LCSC Part Name: Type-C 母座 卧贴 长7.35 四脚贴板; Supplier Footprint: SMD; Datasheet: https://atta.szlcsc.com/upload/public/pdf/source/20210615/C2840392_E4D6700BD82FA37F52F4054C59437243.pdf; Convert to PCB: yes; Standard: USB 3.1; Mounting Style: 卧贴; Contact Material: -; Contact Plating: -; Operating Temperature Range: -25℃~+85℃